# Altium schematic sheet Sheet1.SchDoc
size A4; SheetNumber: 1; SheetTotal: 2
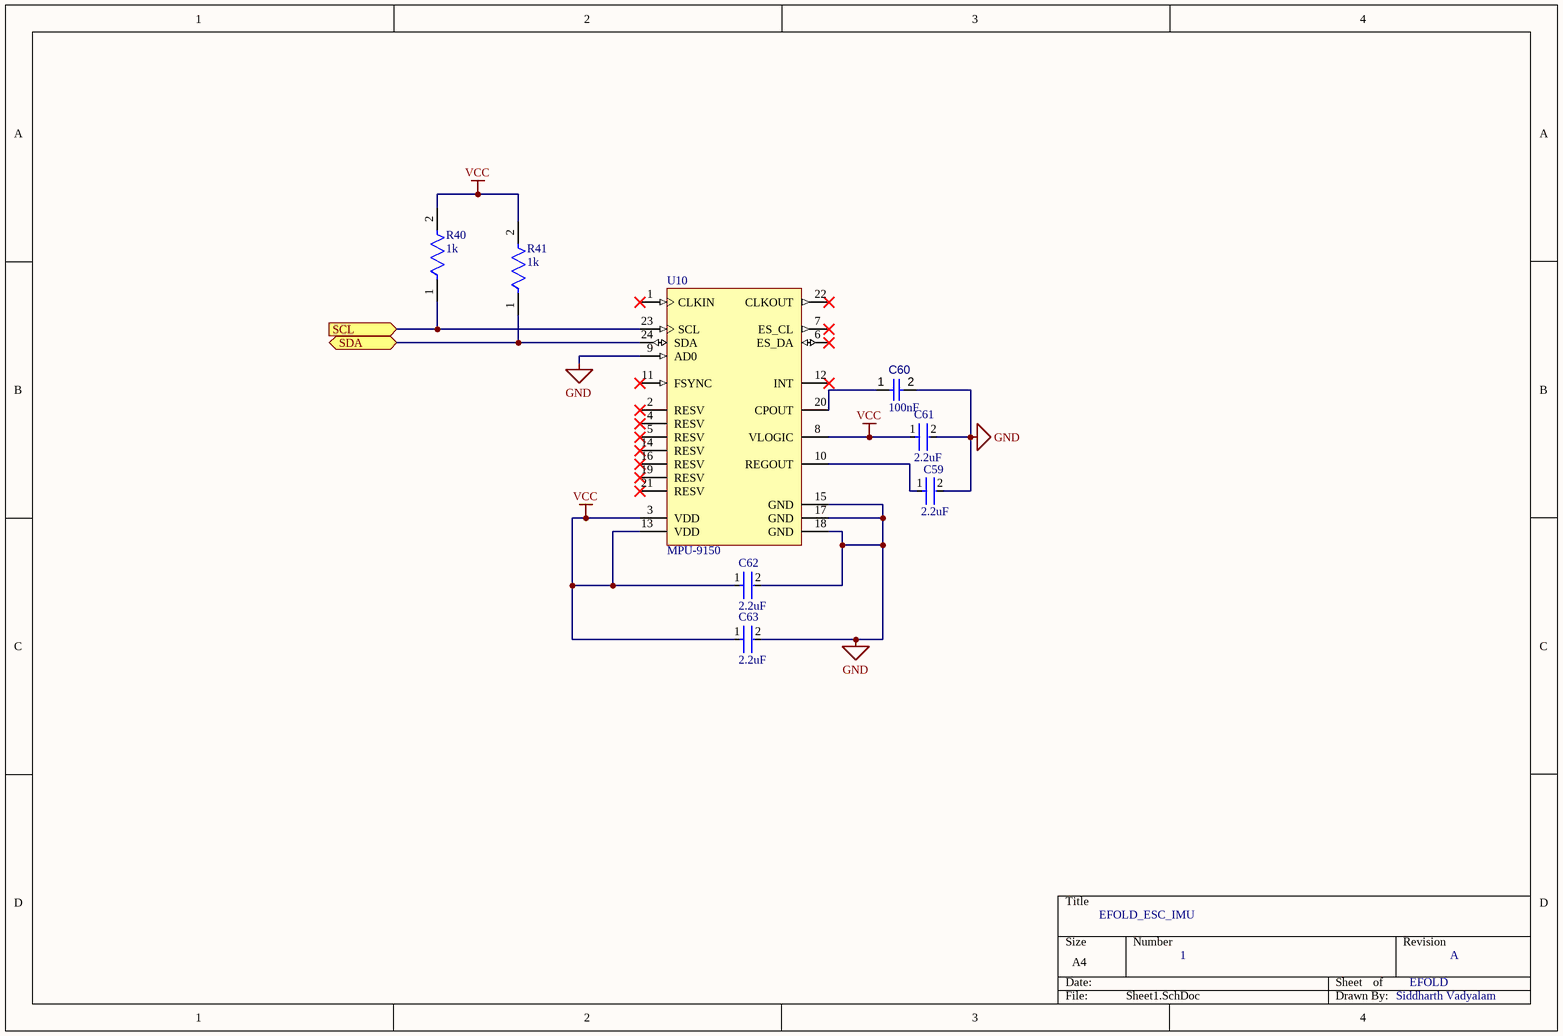
[diagram p0: Sheet1.SchDoc]

## Parts
C59  2.2uF  [FP-GRM188-0_1-e0_2_0_5-MFG]
C60  value 100nF  [CAPC1608X90X40NL10T20]  (hidden comment: Capacitor 100 nF +/-10% 50 V 0603)
C61  2.2uF  [FP-GRM188-0_1-e0_2_0_5-MFG]
C62  2.2uF  [FP-GRM188-0_1-e0_2_0_5-MFG]
C63  2.2uF  [FP-GRM188-0_1-e0_2_0_5-MFG]
R40  1k  [FP-ESR03-IPC_A]
R41  1k  [FP-ESR03-IPC_A]
U10  MPU-9150  [IS-QFN-24_4000X4000X1100_V]

## Ports
SCL (in), SDA (bidir)

## Nets
GND: C59.2 C60.2 C61.2 C62.2 C63.2 U10.9(AD0) U10.15(GND) U10.17(GND) U10.18(GND)
VCC: C61.1 C62.1 C63.1 R40.2 R41.2 U10.3(VDD) U10.8(VLOGIC) U10.13(VDD)
SCL: R40.1 U10.23(SCL) ; port SCL
SDA: R41.1 U10.24(SDA) ; port SDA
NetC59_1: C59.1 U10.10(REGOUT)
NetC60_1: C60.1 U10.20(CPOUT)

Not connected (* = marked no-connect by the designer): U10 1(CLKIN)* 2(RESV)* 4(RESV)* 5(RESV)* 6(ES_DA)* 7(ES_CL)* 11(FSYNC)* 12(INT)* 14(RESV)* 16(RESV)* 19(RESV)* 21(RESV)* 22(CLKOUT)*

## Notes on the sheet
- EFOLD_ESC_IMU
- 1
- EFOLD
- A
- Siddharth Vadyalam

## Library data of the parts
C59 C61-C63 = CMP-2006-02836-2: Chip Multilayer Ceramic Capacitors for General Purpose, 0603, 2.2uF, X7R, 15%, 10%, 10V; Case Code (Metric): 1608; Height: 0.8mm; Packaging: Cut Tape; Voltage: 10V; Lead Free: Lead Free; Min Operating Temperature: -55°C; Voltage Rating (DC): 10V; Max Operating Temperature: 125°C; Voltage Rating: 10V; Dielectric: X7R; Depth: 0.8mm; Case Code (Imperial): 0603; Termination: SMD/SMT; Case/Package: 0603; Number of Pins: 2; REACH SVHC: No SVHC; Mount: Surface Mount; Width: 0.031inch; Material: Ceramic; Capacitance: 2.2uF; Package Quantity: 1; Weight: 7.1E-05oz; Length: 1.6mm; Thickness: 0.035inch; Tolerance: 10%
C60 = CMP-001-00017-6: Chip Capacitor, 100 nF, +/- 10%, 50 V, 0603 (1608 Metric); Voltage Rating: 50V; Capacitor Type: Ceramic; Tolerance: 10%; Mounting Technology: SM; Max Operating Temperature: 125°C; RoHS Compliant: True; Pins: 2; Case/Package: 0603; Min Operating Temperature: -55°C
R40 R41 = CMP-08839-029483-1: 1kΩ ±1% 0.25W 0603 Anti-Surge Chip Resistor AEC-Q200; Power Rating: 250mW; Resistance: 1kR; Temperature Coefficient: 100ppm/°C; Series: ESR; Max Operating Temperature: 155°C; Case Code (Metric): 1608; Package Quantity: 1; Case/Package: 0603; Size Code: 0603; Case Code (Imperial): 0603; Min Operating Temperature: -55°C; Tolerance: 1%; Max Power Dissipation: 250mW; Number of Terminations: 2; RoHS Compliant: Yes; Lead Free: Lead Free; Packaging: Tape and Reel; Height: 0.022inch; Width: 0.031inch; Features: Automotive AEC-Q200; Resistor Type: Thick Film; Length: 0.063inch
U10 = CMP-2000-05158-1: 9-Axis MotionTracking Device, 2.375 to 3.465 V, -40 to 85 degC, 24-Pin QFN, RoHS, Tape and Reel; Manufacturer: InvenSense; Featured Product: MPU-9150Nine-Axis(Gyro+Accelerometer+Compass)MEMSMotionTracking™Device; Output Type: I²C; PCN Obsolescence/ EOL: MPU-9150Devices25/Mar/2015; Sensor Type: Accelerometer,Gyroscope,Magnetometer,3Axis; Other Names: 1428-1009-2 / MPU9150; For Use With: 1471-1460-ND / -MPU9DOFCLICK / 1568-1017-ND / -MPU-9150GYROACCELIMU9DOF / 1428-1010-ND / -BOARDEVALFORMPU-9150; Manufacturer URL: http://www.invensense.com/; Category: Sensors,Transducers; Operating Temperature: -40degC~85degC(TA); Datasheet URL: http://datasheet.octopart.com/MPU-9150-InvenSense-datasheet-11519227.pdf; Series: MotionTracking™; Datasheet Version: Rev. 4.0, 05/2012; Family: Multifunction; Standard Package: 5,000